# Altium project ultrazed_base.PrjPcb (part 2 of 2)

## Sheet Switches_Leds.SchDoc
size A3; SheetNumber: 9; SheetTotal: 13
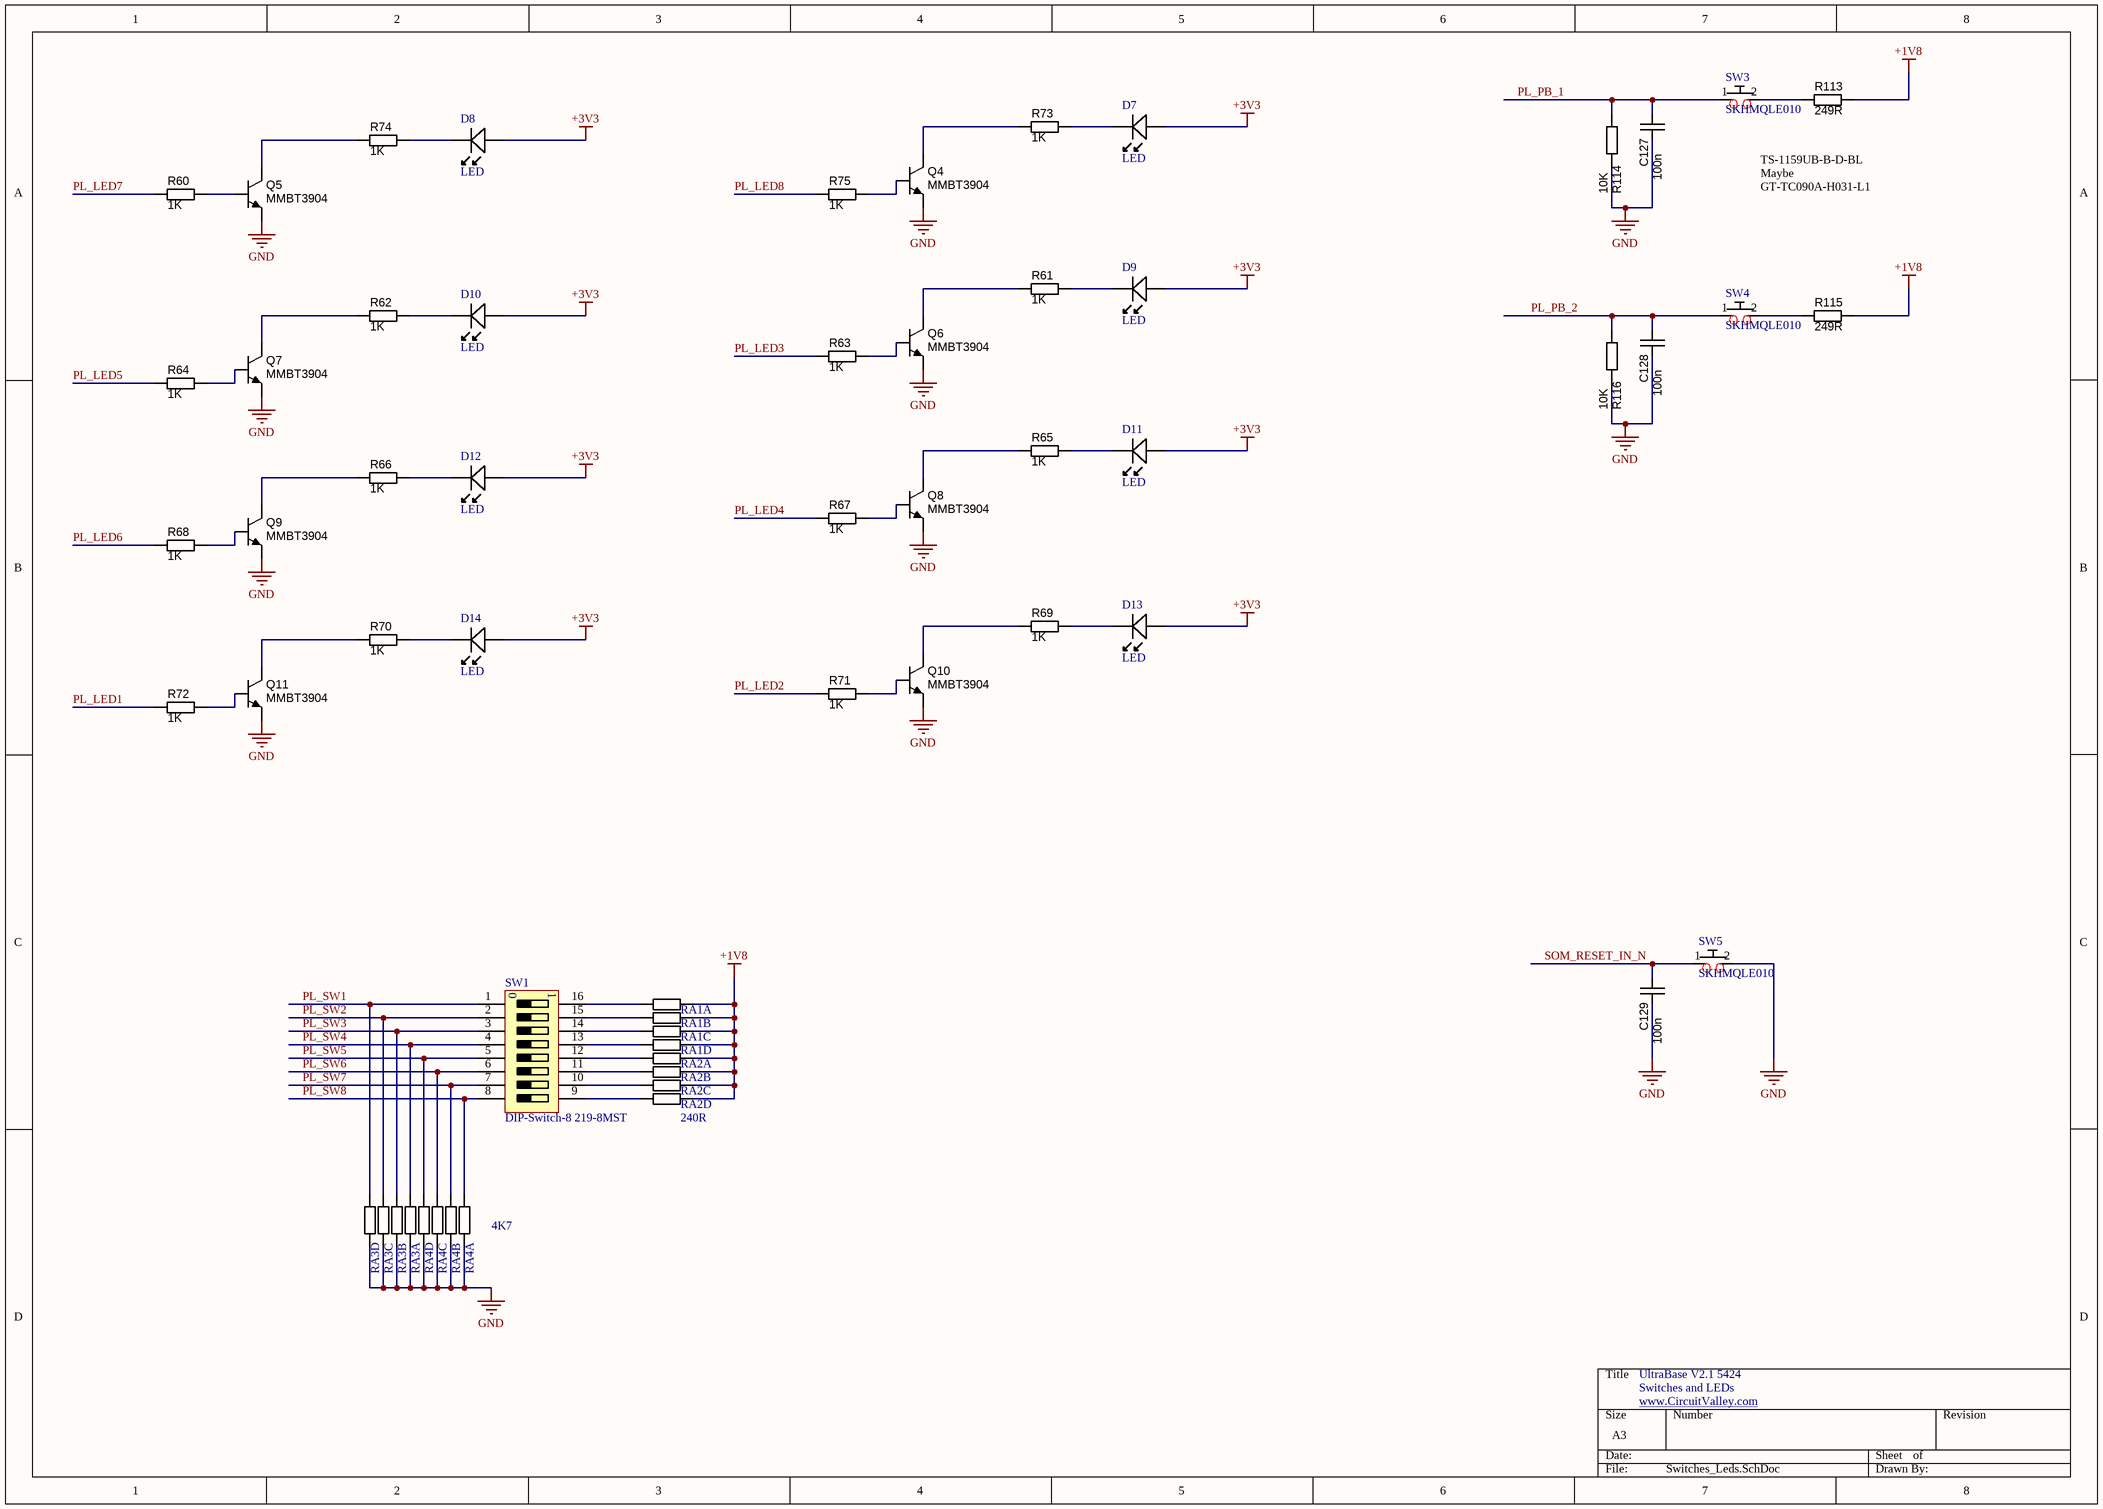
[diagram p8: Switches_Leds.SchDoc]

### Parts
C127  100n  [CAPC1608N]
C128  100n  [CAPC1608N]
C129  100n  [CAPC1608N]
D7  LED  [1206_LED]
D8  LED  [1206_LED]
D9  LED  [1206_LED]
D10  LED  [1206_LED]
D11  LED  [1206_LED]
D12  LED  [1206_LED]
D13  LED  [1206_LED]
D14  LED  [1206_LED]
Q4  Manufacturer Part Number 1: MMBT3904  [SOT23-3]  (hidden comment: NPN_MMBT3904)
Q5  Manufacturer Part Number 1: MMBT3904  [SOT23-3]  (hidden comment: NPN_MMBT3904)
Q6  Manufacturer Part Number 1: MMBT3904  [SOT23-3]  (hidden comment: NPN_MMBT3904)
Q7  Manufacturer Part Number 1: MMBT3904  [SOT23-3]  (hidden comment: NPN_MMBT3904)
Q8  Manufacturer Part Number 1: MMBT3904  [SOT23-3]  (hidden comment: NPN_MMBT3904)
Q9  Manufacturer Part Number 1: MMBT3904  [SOT23-3]  (hidden comment: NPN_MMBT3904)
Q10  Manufacturer Part Number 1: MMBT3904  [SOT23-3]  (hidden comment: NPN_MMBT3904)
Q11  Manufacturer Part Number 1: MMBT3904  [SOT23-3]  (hidden comment: NPN_MMBT3904)
R60  value 1K  [RESC1608N]  (hidden comment: RES_NL_0603)
R61  value 1K  [RESC1608N]  (hidden comment: RES_NL_0603)
R62  value 1K  [RESC1608N]  (hidden comment: RES_NL_0603)
R63  value 1K  [RESC1608N]  (hidden comment: RES_NL_0603)
R64  value 1K  [RESC1608N]  (hidden comment: RES_NL_0603)
R65  value 1K  [RESC1608N]  (hidden comment: RES_NL_0603)
R66  value 1K  [RESC1608N]  (hidden comment: RES_NL_0603)
R67  value 1K  [RESC1608N]  (hidden comment: RES_NL_0603)
R68  value 1K  [RESC1608N]  (hidden comment: RES_NL_0603)
R69  value 1K  [RESC1608N]  (hidden comment: RES_NL_0603)
R70  value 1K  [RESC1608N]  (hidden comment: RES_NL_0603)
R71  value 1K  [RESC1608N]  (hidden comment: RES_NL_0603)
R72  value 1K  [RESC1608N]  (hidden comment: RES_NL_0603)
R73  value 1K  [RESC1608N]  (hidden comment: RES_NL_0603)
R74  value 1K  [RESC1608N]  (hidden comment: RES_NL_0603)
R75  value 1K  [RESC1608N]  (hidden comment: RES_NL_0603)
R113  value 249R  [RESC1608N]  (hidden comment: RES_NL_0603)
R114  value 10K  [RESC1608N]  (hidden comment: RES_NL_0603)
R115  value 249R  [RESC1608N]  (hidden comment: RES_NL_0603)
R116  value 10K  [RESC1608N]  (hidden comment: RES_NL_0603)
RA1  Thick Film  [YC164]  (value not drawn)  (parts A,B,C,D of 4)
RA2  Thick Film  [YC164]  (value not drawn)  (parts A,B,C,D of 4)
RA3  Thick Film  [YC164]  (value not drawn)  (parts A,B,C,D of 4)
RA4  Thick Film  [YC164]  (value not drawn)  (parts A,B,C,D of 4)
SW1  DIP-Switch-8 219-8MST  [219-8MST]
SW3  SKHMQLE010  [SKHMQLE010]
SW4  SKHMQLE010  [SKHMQLE010]
SW5  SKHMQLE010  [SKHMQLE010]

### Nets
+1V8: R113.1 R115.1 RA1.1 RA1.2 RA1.3 RA1.4 RA2.1 RA2.2 RA2.3 RA2.4
+3V3: D7.A D8.A D9.A D10.A D11.A D12.A D13.A D14.A
GND: C127.2 C128.2 C129.2 Q4.2(E) Q5.2(E) Q6.2(E) Q7.2(E) Q8.2(E) Q9.2(E) Q10.2(E) Q11.2(E) R114.1 R116.1 RA3.1 RA3.2 RA3.3 RA3.4 RA4.1 RA4.2 RA4.3 RA4.4 SW5.2(P2)
PL_LED1: R72.1
PL_LED2: R71.1
PL_LED3: R63.1
PL_LED4: R67.1
PL_LED5: R64.1
PL_LED6: R68.1
PL_LED7: R60.1
PL_LED8: R75.1
PL_PB_1: C127.1 R114.2 SW3.1(P1)
PL_PB_2: C128.1 R116.2 SW4.1(P1)
PL_SW1: RA3.5 SW1.1
PL_SW2: RA3.6 SW1.2
PL_SW3: RA3.7 SW1.3
PL_SW4: RA3.8 SW1.4
PL_SW5: RA4.5 SW1.5
PL_SW6: RA4.6 SW1.6
PL_SW7: RA4.7 SW1.7
PL_SW8: RA4.8 SW1.8
SOM_RESET_IN_N: C129.1 SW5.1(P1)
NetD7_K: D7.K R73.2
NetD8_K: D8.K R74.2
NetD9_K: D9.K R61.2
NetD10_K: D10.K R62.2
NetD11_K: D11.K R65.2
NetD12_K: D12.K R66.2
NetD13_K: D13.K R69.2
NetD14_K: D14.K R70.2
NetQ4_1: Q4.1(B) R75.2
NetQ4_3: Q4.3(C) R73.1
NetQ5_1: Q5.1(B) R60.2
NetQ5_3: Q5.3(C) R74.1
NetQ6_1: Q6.1(B) R63.2
NetQ6_3: Q6.3(C) R61.1
NetQ7_1: Q7.1(B) R64.2
NetQ7_3: Q7.3(C) R62.1
NetQ8_1: Q8.1(B) R67.2
NetQ8_3: Q8.3(C) R65.1
NetQ9_1: Q9.1(B) R68.2
NetQ9_3: Q9.3(C) R66.1
NetQ10_1: Q10.1(B) R71.2
NetQ10_3: Q10.3(C) R69.1
NetQ11_1: Q11.1(B) R72.2
NetQ11_3: Q11.3(C) R70.1
NetR113_2: R113.2 SW3.2(P2)
NetR115_2: R115.2 SW4.2(P2)
NetRA1_5: RA1.5 SW1.13
NetRA1_6: RA1.6 SW1.14
NetRA1_7: RA1.7 SW1.15
NetRA1_8: RA1.8 SW1.16
NetRA2_5: RA2.5 SW1.9
NetRA2_6: RA2.6 SW1.10
NetRA2_7: RA2.7 SW1.11
NetRA2_8: RA2.8 SW1.12

### Notes on the sheet
- TS-1159UB-B-D-BL
  Maybe GT-TC090A-H031-L1 as SKHMQLE010 Replament .
- (near RA2) 240R
- (near RA4) 4K7
- UltraBase V2.1 5424
- Switches and LEDs
- www.CircuitValley.com <http://www.CircuitValley.com>
- (in symbol DIP-Switch-8) 0

### Library data of the parts
C127-C129 = CAPC_120p_0603_C0G_50V: Capacitor SMD Cer 120pF 10% 50V C0G 0603; Manufacturer 1: Kemet; Manufacturer Part Number 1: C0603C121K5GACTU; Ratings: 50V; C0G; Tolerance: ±10%; Operating Temperature: -55°C ~ 125°C; Package / Case: 0603 (1608 Metric); Supplier 1: Mouser; Supplier Part Number 1: 80-C0603C121K5G; Value: 100n
Q4-Q11 = NPN_MMBT3904: Transistor SMD NPN 40V 0.2A 350mW SOT-23; Manufacturer 1: Fairchild Semiconductor; Ratings: 40V; 200mA; 350mW; Material: Si; Package / Case: SOT-23; Supplier 1: Digi-Key; Supplier Part Number 1: MMBT3904FSCT-ND; Transistor Type: NPN; Mounting Type: Surface Mount
R60-R75 R113-R116 = RES_NL_0603: as R17 on sheet PCIe; Package / Case: 0603 (1608 metric)
RA1 = RES_ARRAY_0402_5%: Resistor array 4-pack 5% 0402 SMD; Value: 240R
RA2 RA3 = RES_ARRAY_0402_5%: Resistor array 4-pack 5% 0402 SMD
RA4 = RES_ARRAY_0402_5%: Resistor array 4-pack 5% 0402 SMD; Value: 4.7K
SW1 = DIP-Switch-8: DIP Switch 8 Position
SW3-SW5 = PushButton

## Sheet PWR_INP.SchDoc
size A3; SheetNumber: 10; SheetTotal: 13
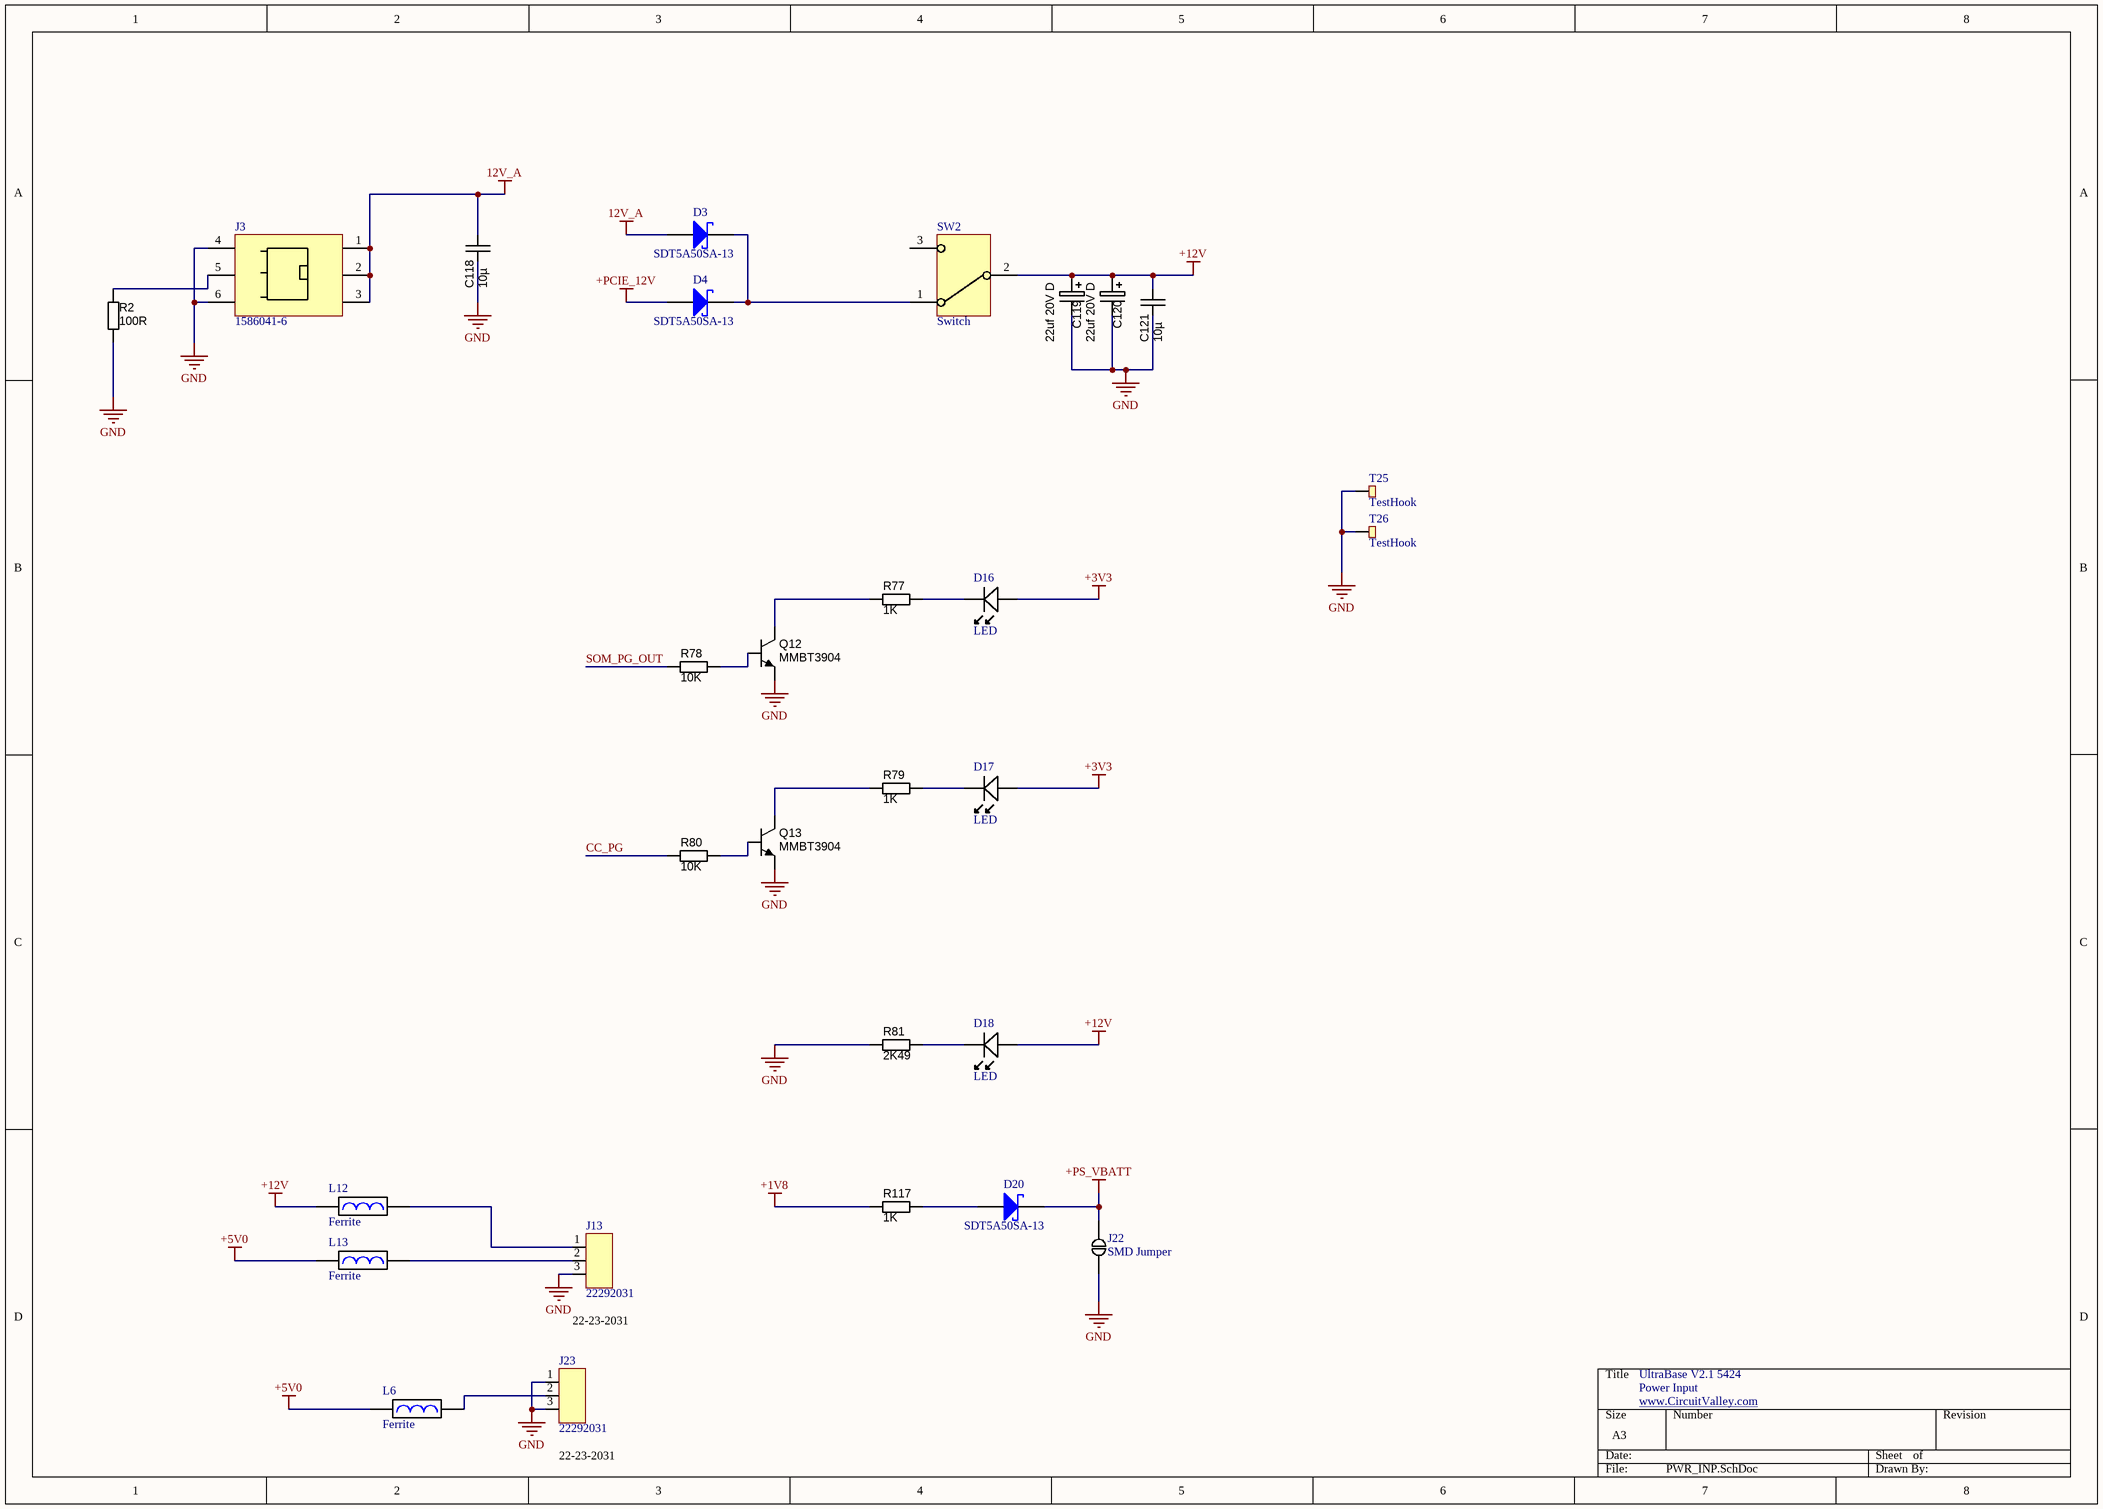
[diagram p9: PWR_INP.SchDoc]

### Parts
C118  10µ  [CAPC3225N]
C119  value 22uf 20V D  [CAPMP7343X310N]  (hidden comment: 47uf 20V D)
C120  value 22uf 20V D  [CAPMP7343X310N]  (hidden comment: 47uf 20V D)
C121  10µ  [CAPC3225N]
D3  SDT5A50SA-13  [DO-214AC]
D4  SDT5A50SA-13  [DO-214AC]
D16  LED  [1206_LED]
D17  LED  [1206_LED]
D18  LED  [1206_LED]
D20  SDT5A50SA-13  [DO-214AC]
J3  1586041-6  [1586043-6]
J13  22292031  [22-23-2031]
J22  SMD Jumper  [SMD_Jumper]  (net tie, no BOM)
J23  22292031  [22-23-2031]
L6  Ferrite  [FBC2012N]
L12  Ferrite  [FBC2012N]
L13  Ferrite  [FBC2012N]
Q12  Manufacturer Part Number 1: MMBT3904  [SOT23-3]  (hidden comment: NPN_MMBT3904)
Q13  Manufacturer Part Number 1: MMBT3904  [SOT23-3]  (hidden comment: NPN_MMBT3904)
R2  value 100R  [RESC1608N]  (hidden comment: RES_NL_0603)
R77  value 1K  [RESC1608N]  (hidden comment: RES_NL_0603)
R78  value 10K  [RESC1608N]  (hidden comment: RES_NL_0603)
R79  value 1K  [RESC1608N]  (hidden comment: RES_NL_0603)
R80  value 10K  [RESC1608N]  (hidden comment: RES_NL_0603)
R81  value 2K49  [RESC1608N]  (hidden comment: RES_NL_0603)
R117  value 1K  [RESC1608N]  (hidden comment: RES_NL_0603)
SW2  Switch  [1MS1T1B4M7QES]
T25  TestHook  [1502-x]
T26  TestHook  [1502-x]

### Nets
12V_A: C118.1 D3.1(A) J3.1(IN) J3.2(IN) J3.3(IN)
+1V8: R117.1
+3V3: D16.A D17.A
+5V0: L6.1 L13.1
+12V: C119.1 C120.1 C121.1 D18.A L12.1 SW2.2
+PCIE_12V: D4.1(A)
+PS_VBATT: D20.2(K) J22.2
GND: C118.2 C119.2 C120.2 C121.2 J3.4(IN) J3.6 J13.3 J22.1 J23.1 J23.3 Q12.2(E) Q13.2(E) R2.2 R81.1 T25.1(TP) T26.1(TP)
CC_PG: R80.1
SOM_PG_OUT: R78.1
NetD3_2: D3.2(K) D4.2(K) SW2.1
NetD16_K: D16.K R77.2
NetD17_K: D17.K R79.2
NetD18_K: D18.K R81.2
NetD20_1: D20.1(A) R117.2
NetJ3_5: J3.5 R2.1
NetJ13_1: J13.1 L12.2
NetJ13_2: J13.2 L13.2
NetJ23_2: J23.2 L6.2
NetQ12_1: Q12.1(B) R78.2
NetQ12_3: Q12.3(C) R77.1
NetQ13_1: Q13.1(B) R80.2
NetQ13_3: Q13.3(C) R79.1

Not connected (* = marked no-connect by the designer): SW2 3

### Notes on the sheet
- 22-23-2031
- UltraBase V2.1 5424
- Power Input
- (near J23) 22-23-2031
- www.CircuitValley.com <http://www.CircuitValley.com>

### Library data of the parts
C118 C121 = CAPC_10u_1210_50V: Capacitor SMD Cer 10uF 20% 16V X5R 1210; Manufacturer 1: Taiyo Yuden; Manufacturer Part Number 1: UMK325BJ106MM-T; Ratings: 50V; X5R; Material: ceramic; Package / Case: 1210 (3225 Metric); Tolerance: ±20%; Size / Dimension: 0.126" L x 0.098" W (3.20mm x 2.50mm); Supplier 1: Digi-Key; Supplier Part Number 1: 587-2225-1-ND; Value: 10µ
C119 C120 = CAPT_330u_2917_6V3: Capacitor SMD Tant 330uF 20% 6V3 2917; Manufacturer Part Number: T520D337M006ATE015; Part: TCJY226M025R0070; Ratings: 6.3V; Material: Solid Tantalum; ESR (Equivalent Series Resistance): 15 mOhm; Package / Case: 2917 (7343 Metric); Tolerance: ±20%; Operating Temperature: -55°C ~ 125°C; Size / Dimension: 0.287" L x 0.169" W (7.30mm x 4.30mm); Height - Seated (Max): 0.122" (3.10mm); Manufacturer Size Code: D; Supplier 1: Digi-Key; Supplier Part Number 1: 399-4052-1-ND; ComponentLink1URL: http://www.kemet.com/datasheets&T520D337M006ATE015; ComponentLink1Description: T520D Datasheet
D3 D4 D20 = Diode
J3 = 1586041-6: PCIE Molex Power
J22 = SMD_Jumper
L6 L12 L13 = Ferrite Bead
Q12 Q13 = NPN_MMBT3904: as Q4 on sheet Switches_Leds; Package / Case: SOT-23; Supplier 1: Digi-Key; Supplier Part Number 1: MMBT3904FSCT-ND; Transistor Type: NPN; Mounting Type: Surface Mount
R2 R77-R81 R117 = RES_NL_0603: as R17 on sheet PCIe; Package / Case: 0603 (1608 metric)
SW2 = Switch_SPDT: Switch SPDT

## Sheet IO.SchDoc
size A3; SheetNumber: 11; SheetTotal: 13
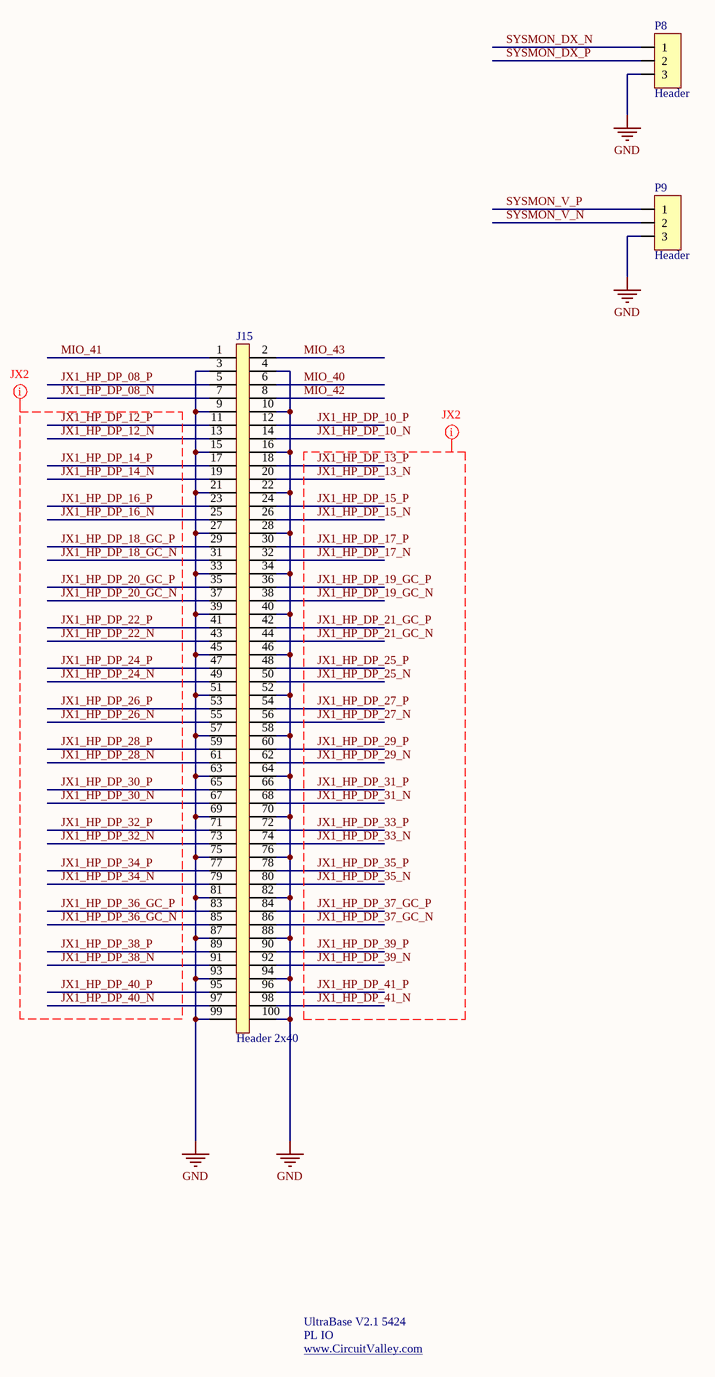
[diagram p10: IO.SchDoc]

### Parts
J15  Header 2x40  [Header_2x50]
P8  Header  [Header3x]
P9  Header  [Header3x]

### Nets
GND: J15.3 J15.4 J15.9 J15.10 J15.15 J15.16 J15.21 J15.22 J15.27 J15.28 J15.33 J15.34 J15.39 J15.40 J15.45 J15.46 J15.51 J15.52 J15.57 J15.58 J15.63 J15.64 J15.69 J15.70 J15.75 J15.76 J15.81 J15.82 J15.87 J15.88 J15.93 J15.94 J15.99 J15.100 P8.3 P9.3
JX1_HP_DP_08_N: J15.7
JX1_HP_DP_08_P: J15.5
JX1_HP_DP_10_N: J15.14
JX1_HP_DP_10_P: J15.12
JX1_HP_DP_12_N: J15.13
JX1_HP_DP_12_P: J15.11
JX1_HP_DP_13_N: J15.20
JX1_HP_DP_13_P: J15.18
JX1_HP_DP_14_N: J15.19
JX1_HP_DP_14_P: J15.17
JX1_HP_DP_15_N: J15.26
JX1_HP_DP_15_P: J15.24
JX1_HP_DP_16_N: J15.25
JX1_HP_DP_16_P: J15.23
JX1_HP_DP_17_N: J15.32
JX1_HP_DP_17_P: J15.30
JX1_HP_DP_18_GC_N: J15.31
JX1_HP_DP_18_GC_P: J15.29
JX1_HP_DP_19_GC_N: J15.38
JX1_HP_DP_19_GC_P: J15.36
JX1_HP_DP_20_GC_N: J15.37
JX1_HP_DP_20_GC_P: J15.35
JX1_HP_DP_21_GC_N: J15.44
JX1_HP_DP_21_GC_P: J15.42
JX1_HP_DP_22_N: J15.43
JX1_HP_DP_22_P: J15.41
JX1_HP_DP_24_N: J15.49
JX1_HP_DP_24_P: J15.47
JX1_HP_DP_25_N: J15.50
JX1_HP_DP_25_P: J15.48
JX1_HP_DP_26_N: J15.55
JX1_HP_DP_26_P: J15.53
JX1_HP_DP_27_N: J15.56
JX1_HP_DP_27_P: J15.54
JX1_HP_DP_28_N: J15.61
JX1_HP_DP_28_P: J15.59
JX1_HP_DP_29_N: J15.62
JX1_HP_DP_29_P: J15.60
JX1_HP_DP_30_N: J15.67
JX1_HP_DP_30_P: J15.65
JX1_HP_DP_31_N: J15.68
JX1_HP_DP_31_P: J15.66
JX1_HP_DP_32_N: J15.73
JX1_HP_DP_32_P: J15.71
JX1_HP_DP_33_N: J15.74
JX1_HP_DP_33_P: J15.72
JX1_HP_DP_34_N: J15.79
JX1_HP_DP_34_P: J15.77
JX1_HP_DP_35_N: J15.80
JX1_HP_DP_35_P: J15.78
JX1_HP_DP_36_GC_N: J15.85
JX1_HP_DP_36_GC_P: J15.83
JX1_HP_DP_37_GC_N: J15.86
JX1_HP_DP_37_GC_P: J15.84
JX1_HP_DP_38_N: J15.91
JX1_HP_DP_38_P: J15.89
JX1_HP_DP_39_N: J15.92
JX1_HP_DP_39_P: J15.90
JX1_HP_DP_40_N: J15.97
JX1_HP_DP_40_P: J15.95
JX1_HP_DP_41_N: J15.98
JX1_HP_DP_41_P: J15.96
MIO_40: J15.6
MIO_41: J15.1
MIO_42: J15.8
MIO_43: J15.2
SYSMON_DX_N: P8.1
SYSMON_DX_P: P8.2
SYSMON_V_N: P9.2
SYSMON_V_P: P9.1

### Layout directives
net class JX2: JX1_HP_DP_12_N, JX1_HP_DP_12_P, JX1_HP_DP_13_N, JX1_HP_DP_13_P, JX1_HP_DP_14_N, JX1_HP_DP_14_P, JX1_HP_DP_15_N, JX1_HP_DP_15_P, JX1_HP_DP_16_N, JX1_HP_DP_16_P, JX1_HP_DP_17_N, JX1_HP_DP_17_P, JX1_HP_DP_18_GC_N, JX1_HP_DP_18_GC_P, JX1_HP_DP_19_GC_N, JX1_HP_DP_19_GC_P, JX1_HP_DP_20_GC_N, JX1_HP_DP_20_GC_P, JX1_HP_DP_21_GC_N, JX1_HP_DP_21_GC_P, JX1_HP_DP_22_N, JX1_HP_DP_22_P, JX1_HP_DP_24_N, JX1_HP_DP_24_P, JX1_HP_DP_25_N, JX1_HP_DP_25_P, JX1_HP_DP_26_N, JX1_HP_DP_26_P, JX1_HP_DP_27_N, JX1_HP_DP_27_P, JX1_HP_DP_28_N, JX1_HP_DP_28_P, JX1_HP_DP_29_N, JX1_HP_DP_29_P, JX1_HP_DP_30_N, JX1_HP_DP_30_P, JX1_HP_DP_31_N, JX1_HP_DP_31_P, JX1_HP_DP_32_N, JX1_HP_DP_32_P, JX1_HP_DP_33_N, JX1_HP_DP_33_P, JX1_HP_DP_34_N, JX1_HP_DP_34_P, JX1_HP_DP_35_N, JX1_HP_DP_35_P, JX1_HP_DP_36_GC_N, JX1_HP_DP_36_GC_P, JX1_HP_DP_37_GC_N, JX1_HP_DP_37_GC_P, JX1_HP_DP_38_N, JX1_HP_DP_38_P, JX1_HP_DP_39_N, JX1_HP_DP_39_P, JX1_HP_DP_40_N, JX1_HP_DP_40_P, JX1_HP_DP_41_N, JX1_HP_DP_41_P

### Notes on the sheet
- UltraBase V2.1 5424
- PL IO
- www.CircuitValley.com <http://www.CircuitValley.com>

### Library data of the parts
J15 = Header_2x50
P8 P9 = Header_3Pin: 3 Pin Header; Value: NC

## Sheet JTAG.SchDoc
size A3; SheetNumber: 12; SheetTotal: 13
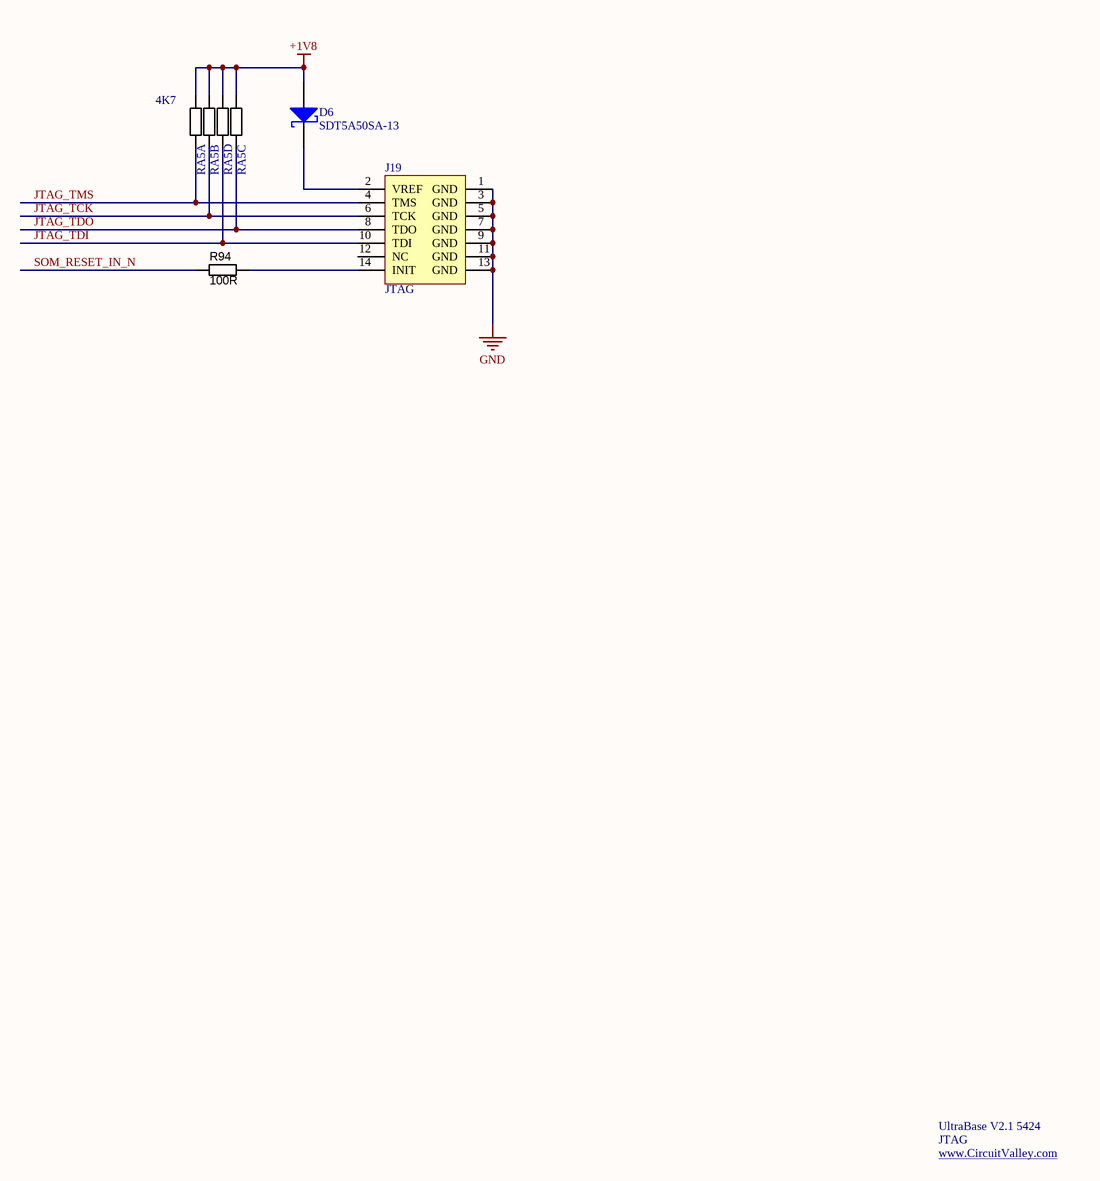
[diagram p11: JTAG.SchDoc]

### Parts
D6  SDT5A50SA-13  [DO-214AC]
J19  JTAG  [878321420]
R94  value 100R  [RESC1608N]  (hidden comment: RES_NL_0603)
RA5  Thick Film  [YC164]  (value not drawn)  (parts A,B,C,D of 4)

### Nets
+1V8: D6.1(A) RA5.5 RA5.6 RA5.7 RA5.8
GND: J19.1(GND) J19.3(GND) J19.5(GND) J19.7(GND) J19.9(GND) J19.11(GND) J19.13(GND)
JTAG_TCK: J19.6(TCK) RA5.2
JTAG_TDI: J19.10(TDI) RA5.4
JTAG_TDO: J19.8(TDO) RA5.3
JTAG_TMS: J19.4(TMS) RA5.1
SOM_RESET_IN_N: R94.2
NetD6_2: D6.2(K) J19.2(VREF)
NetJ19_14: J19.14(INIT) R94.1

Not connected (* = marked no-connect by the designer): J19 12(NC)

### Notes on the sheet
- (near RA5) 4K7
- UltraBase V2.1 5424
- JTAG
- www.CircuitValley.com <http://www.CircuitValley.com>

### Library data of the parts
D6 = Diode
J19 = Xilinx_JTAG
R94 = RES_NL_0603: as R17 on sheet PCIe; Package / Case: 0603 (1608 metric)
RA5 = RES_ARRAY_0402_5%: Resistor array 4-pack 5% 0402 SMD

## Sheet MIPI.SchDoc
size A3; SheetNumber: 13; SheetTotal: 13
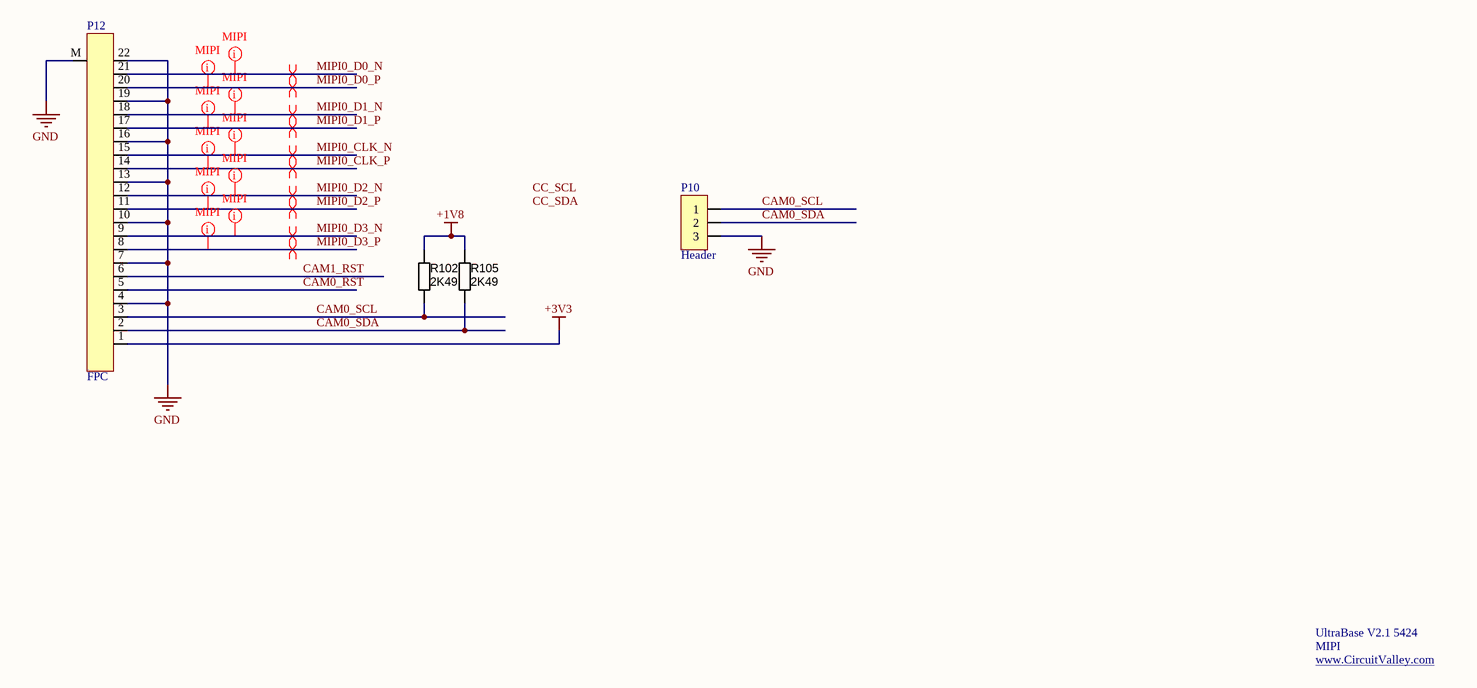
[diagram p12: MIPI.SchDoc]

### Parts
P10  Header  [Header3x]
P12  FPC  [AFC11-S22ICA-00]
R102  value 2K49  [RESC1608N]  (hidden comment: RES_NL_0603)
R105  value 2K49  [RESC1608N]  (hidden comment: RES_NL_0603)

### Nets
+1V8: R102.2 R105.2
+3V3: P12.1
GND: P10.3 P12.4 P12.7 P12.10 P12.13 P12.16 P12.19 P12.22 P12.M
CAM0_RST: P12.5
CAM0_SCL: P10.1 P12.3 R102.1
CAM0_SDA: P10.2 P12.2 R105.1
CAM1_RST: P12.6
MIPI0_CLK_N: P12.15
MIPI0_CLK_P: P12.14
MIPI0_D0_N: P12.21
MIPI0_D0_P: P12.20
MIPI0_D1_N: P12.18
MIPI0_D1_P: P12.17
MIPI0_D2_N: P12.12
MIPI0_D2_P: P12.11
MIPI0_D3_N: P12.9
MIPI0_D3_P: P12.8

### Layout directives
differential pair: MIPI0_CLK_N, MIPI0_CLK_P, MIPI0_D0_N, MIPI0_D0_P, MIPI0_D1_N, MIPI0_D1_P, MIPI0_D2_N, MIPI0_D2_P, MIPI0_D3_N, MIPI0_D3_P
net class MIPI: MIPI0_CLK_N, MIPI0_CLK_P, MIPI0_D0_N, MIPI0_D0_P, MIPI0_D1_N, MIPI0_D1_P, MIPI0_D2_N, MIPI0_D2_P, MIPI0_D3_N, MIPI0_D3_P

### Notes on the sheet
- UltraBase V2.1 5424
- MIPI
- www.CircuitValley.com <http://www.CircuitValley.com>
- Labels drawn without touching a wire or pin: CC_SCL, CC_SDA

### Library data of the parts
P10 = Header_3Pin: 3 Pin Header; Value: NC
P12 = FPC22_PIN: FPC 22 Pin
R102 R105 = RES_NL_0603: Resistor, SMD chip; Manufacturer 1: Royal Ohm; Ratings: 1/10 W; Tolerance: ±5%; Package / Case: 0603 (1608 metric)

## Nets that join several sheets
+0V85: SOM_JX_MIO (C1.1 C2.1 C62.1), POWER (10 pins)
+1V8: PL_Conenctor (9 pins), POWER (16 pins), Ethernet (7 pins), Clock (6 pins), Switches_Leds (10 pins), PWR_INP (R117.1), JTAG (5 pins), MIPI (R102.2 R105.2)
+1V8_LDO: SOM_JX_MIO (C3.1 C4.1), POWER (6 pins)
+3V3: PL_Conenctor (C8.1 C9.1 C10.1), PCIe (D19.A P3.1 R17.1 R40.2), SOM_JX_MIO (C60.1), MIO_SD (7 pins), POWER (11 pins), Ethernet (J6.14 J6.16), DisplayPort (11 pins), Switches_Leds (8 pins), PWR_INP (D16.A D17.A), MIPI (P12.1)
+5V0: PCIe (C48.1 U3.7), POWER (7 pins), DisplayPort (C63.1 U8.1 U8.3), PWR_INP (L6.1 L13.1)
+12V: PL_Conenctor (C11.1 C12.1 C13.1 C14.1), POWER (27 pins), PWR_INP (6 pins)
+MGTRAVCC: SOM_JX_MIO (JX3.31 JX3.37 JX3.39), POWER (T8.2 T9.2 T10.2)
+MGTRAVTT: SOM_JX_MIO (JX3.36 JX3.42), POWER (T14.2 T16.2)
+PCIE_12V: PCIe (8 pins), PWR_INP (D4.1)
+PS_VBATT: SOM_JX_MIO (JX3.46), PWR_INP (D20.2 J22.2)
+VCCO_HD_26: PL_Conenctor (JX2.18 JX2.24 JX2.30), POWER (T2.2 T4.2 T6.2)
+VCCO_HP_64: PL_Conenctor (JX1.6 JX1.12 JX1.18), POWER (T12.2 T13.2 T15.2)
+VCCO_HP_65: PL_Conenctor (JX1.5 JX1.7 JX1.13), POWER (T3.2 T5.2 T7.2)
+VCCO_HP_66: PL_Conenctor (JX2.17 JX2.23 JX2.29), POWER (T17.2 T18.2 T19.2)
+VCCO_PSIO_501: SOM_JX_MIO (JX3.67), POWER (T11.2)
+VIN: PL_Conenctor (6 pins), POWER (6 pins)
GND: PL_Conenctor (84 pins), PCIe (32 pins), SOM_JX_MIO (29 pins), MIO_SD (8 pins), POWER (55 pins), Ethernet (11 pins), DisplayPort (27 pins), Clock (14 pins), Switches_Leds (22 pins), PWR_INP (16 pins), IO (36 pins), JTAG (7 pins), MIPI (9 pins)
CAM0_RST: PL_Conenctor (JX1.137), MIPI (P12.5)
CAM0_SCL: SOM_JX_MIO (JX3.81), MIPI (P10.1 P12.3 R102.1)
CAM0_SDA: SOM_JX_MIO (JX3.82), MIPI (P10.2 P12.2 R105.1)
CAM1_RST: PL_Conenctor (JX1.139), MIPI (P12.6)
CC_INT#: SOM_JX_MIO (JX3.68), Ethernet (R89.1)
CC_PG: POWER (6 pins), PWR_INP (R80.1)
CC_SCL: SOM_JX_MIO (JX3.44), Ethernet (R88.1 U9.1), Clock (P5.3)
CC_SDA: SOM_JX_MIO (JX3.41), Ethernet (R87.1 U9.3), Clock (P6.3)
DP_AUX_IN: SOM_JX_MIO (JX3.73), DisplayPort (R38.1)
DP_AUX_OE: SOM_JX_MIO (JX3.72), DisplayPort (R33.1)
DP_AUX_OUT: SOM_JX_MIO (JX3.70), DisplayPort (R34.1)
DP_HPD: SOM_JX_MIO (JX3.71), DisplayPort (R12.2)
DP_REFCLK_N: SOM_JX_MIO (JX3.29), Clock (U7.13)
DP_REFCLK_P: SOM_JX_MIO (JX3.27), Clock (U7.14)
DP_TX0_N: SOM_JX_MIO (JX3.3), DisplayPort (C47.1)
DP_TX0_P: SOM_JX_MIO (JX3.1), DisplayPort (C46.1)
ETH_MD1_N: SOM_JX_MIO (JX3.59), Ethernet (J6.10)
ETH_MD1_P: SOM_JX_MIO (JX3.57), Ethernet (J6.11)
ETH_MD2_N: SOM_JX_MIO (JX3.58), Ethernet (J6.5)
ETH_MD2_P: SOM_JX_MIO (JX3.56), Ethernet (J6.4)
ETH_MD3_N: SOM_JX_MIO (JX3.65), Ethernet (J6.2)
ETH_MD3_P: SOM_JX_MIO (JX3.63), Ethernet (J6.3)
ETH_MD4_N: SOM_JX_MIO (JX3.64), Ethernet (J6.9)
ETH_MD4_P: SOM_JX_MIO (JX3.62), Ethernet (J6.8)
GBE_ACT: SOM_JX_MIO (JX3.52), Ethernet (R10.1)
GBE_SPEED: SOM_JX_MIO (JX3.53), Ethernet (R11.1)
JTAG_TCK: PL_Conenctor (JX1.1), JTAG (J19.6 RA5.2)
JTAG_TDI: PL_Conenctor (JX1.4), JTAG (J19.10 RA5.4)
JTAG_TDO: PL_Conenctor (JX1.3), JTAG (J19.8 RA5.3)
JTAG_TMS: PL_Conenctor (JX1.2), JTAG (J19.4 RA5.1)
JX1_HP_DP_08_N: PL_Conenctor (JX1.35), IO (J15.7)
JX1_HP_DP_08_P: PL_Conenctor (JX1.33), IO (J15.5)
JX1_HP_DP_10_N: PL_Conenctor (JX1.41), IO (J15.14)
JX1_HP_DP_10_P: PL_Conenctor (JX1.39), IO (J15.12)
JX1_HP_DP_12_N: PL_Conenctor (JX1.47), IO (J15.13)
JX1_HP_DP_12_P: PL_Conenctor (JX1.45), IO (J15.11)
JX1_HP_DP_13_N: PL_Conenctor (JX1.46), IO (J15.20)
JX1_HP_DP_13_P: PL_Conenctor (JX1.44), IO (J15.18)
JX1_HP_DP_14_N: PL_Conenctor (JX1.53), IO (J15.19)
JX1_HP_DP_14_P: PL_Conenctor (JX1.51), IO (J15.17)
JX1_HP_DP_15_N: PL_Conenctor (JX1.52), IO (J15.26)
JX1_HP_DP_15_P: PL_Conenctor (JX1.50), IO (J15.24)
JX1_HP_DP_16_N: PL_Conenctor (JX1.59), IO (J15.25)
JX1_HP_DP_16_P: PL_Conenctor (JX1.57), IO (J15.23)
JX1_HP_DP_17_N: PL_Conenctor (JX1.58), IO (J15.32)
JX1_HP_DP_17_P: PL_Conenctor (JX1.56), IO (J15.30)
JX1_HP_DP_18_GC_N: PL_Conenctor (JX1.65), IO (J15.31)
JX1_HP_DP_18_GC_P: PL_Conenctor (JX1.63), IO (J15.29)
JX1_HP_DP_19_GC_N: PL_Conenctor (JX1.64), IO (J15.38)
JX1_HP_DP_19_GC_P: PL_Conenctor (JX1.62), IO (J15.36)
JX1_HP_DP_20_GC_N: PL_Conenctor (JX1.71), IO (J15.37)
JX1_HP_DP_20_GC_P: PL_Conenctor (JX1.69), IO (J15.35)
JX1_HP_DP_21_GC_N: PL_Conenctor (JX1.70), IO (J15.44)
JX1_HP_DP_21_GC_P: PL_Conenctor (JX1.68), IO (J15.42)
JX1_HP_DP_22_N: PL_Conenctor (JX1.77), IO (J15.43)
JX1_HP_DP_22_P: PL_Conenctor (JX1.75), IO (J15.41)
JX1_HP_DP_24_N: PL_Conenctor (JX1.83), IO (J15.49)
JX1_HP_DP_24_P: PL_Conenctor (JX1.81), IO (J15.47)
JX1_HP_DP_25_N: PL_Conenctor (JX1.82), IO (J15.50)
JX1_HP_DP_25_P: PL_Conenctor (JX1.80), IO (J15.48)
JX1_HP_DP_26_N: PL_Conenctor (JX1.89), IO (J15.55)
JX1_HP_DP_26_P: PL_Conenctor (JX1.87), IO (J15.53)
JX1_HP_DP_27_N: PL_Conenctor (JX1.88), IO (J15.56)
JX1_HP_DP_27_P: PL_Conenctor (JX1.86), IO (J15.54)
JX1_HP_DP_28_N: PL_Conenctor (JX1.95), IO (J15.61)
JX1_HP_DP_28_P: PL_Conenctor (JX1.93), IO (J15.59)
JX1_HP_DP_29_N: PL_Conenctor (JX1.94), IO (J15.62)
JX1_HP_DP_29_P: PL_Conenctor (JX1.92), IO (J15.60)
JX1_HP_DP_30_N: PL_Conenctor (JX1.101), IO (J15.67)
JX1_HP_DP_30_P: PL_Conenctor (JX1.99), IO (J15.65)
JX1_HP_DP_31_N: PL_Conenctor (JX1.100), IO (J15.68)
JX1_HP_DP_31_P: PL_Conenctor (JX1.98), IO (J15.66)
JX1_HP_DP_32_N: PL_Conenctor (JX1.107), IO (J15.73)
JX1_HP_DP_32_P: PL_Conenctor (JX1.105), IO (J15.71)
JX1_HP_DP_33_N: PL_Conenctor (JX1.106), IO (J15.74)
JX1_HP_DP_33_P: PL_Conenctor (JX1.104), IO (J15.72)
JX1_HP_DP_34_N: PL_Conenctor (JX1.113), IO (J15.79)
JX1_HP_DP_34_P: PL_Conenctor (JX1.111), IO (J15.77)
JX1_HP_DP_35_N: PL_Conenctor (JX1.112), IO (J15.80)
JX1_HP_DP_35_P: PL_Conenctor (JX1.110), IO (J15.78)
JX1_HP_DP_36_GC_N: PL_Conenctor (JX1.119), IO (J15.85)
JX1_HP_DP_36_GC_P: PL_Conenctor (JX1.117), IO (J15.83)
JX1_HP_DP_37_GC_N: PL_Conenctor (JX1.118), IO (J15.86)
JX1_HP_DP_37_GC_P: PL_Conenctor (JX1.116), IO (J15.84)
JX1_HP_DP_38_N: PL_Conenctor (JX1.125), IO (J15.91)
JX1_HP_DP_38_P: PL_Conenctor (JX1.123), IO (J15.89)
JX1_HP_DP_39_N: PL_Conenctor (JX1.124), IO (J15.92)
JX1_HP_DP_39_P: PL_Conenctor (JX1.122), IO (J15.90)
JX1_HP_DP_40_N: PL_Conenctor (JX1.131), IO (J15.97)
JX1_HP_DP_40_P: PL_Conenctor (JX1.129), IO (J15.95)
JX1_HP_DP_41_N: PL_Conenctor (JX1.130), IO (J15.98)
JX1_HP_DP_41_P: PL_Conenctor (JX1.128), IO (J15.96)
MGTRAVCC_SENSE: SOM_JX_MIO (JX3.75), POWER (L7.1)
MGTRAVTT_SENSE: SOM_JX_MIO (JX3.76), POWER (L10.1)
MIO_40: SOM_JX_MIO (JX3.87), IO (J15.6)
MIO_41: SOM_JX_MIO (JX3.88), IO (J15.1)
MIO_42: SOM_JX_MIO (JX3.89), IO (J15.8)
MIO_43: SOM_JX_MIO (JX3.90), IO (J15.2)
MIPI0_CLK_N: PL_Conenctor (JX2.101), MIPI (P12.15)
MIPI0_CLK_P: PL_Conenctor (JX2.99), MIPI (P12.14)
MIPI0_D0_N: PL_Conenctor (JX2.95), MIPI (P12.21)
MIPI0_D0_P: PL_Conenctor (JX2.93), MIPI (P12.20)
MIPI0_D1_N: PL_Conenctor (JX2.88), MIPI (P12.18)
MIPI0_D1_P: PL_Conenctor (JX2.86), MIPI (P12.17)
MIPI0_D2_N: PL_Conenctor (JX2.89), MIPI (P12.12)
MIPI0_D2_P: PL_Conenctor (JX2.87), MIPI (P12.11)
MIPI0_D3_N: PL_Conenctor (JX2.70), MIPI (P12.9)
MIPI0_D3_P: PL_Conenctor (JX2.68), MIPI (P12.8)
PCIE_REFCLK_N: PCIe (J1.A14), SOM_JX_MIO (JX3.40)
PCIE_REFCLK_P: PCIe (J1.A13), SOM_JX_MIO (JX3.38)
PCIE_RST#: PCIe (R40.1 R41.2), SOM_JX_MIO (JX3.74)
PCIE_RX0_N: PCIe (J1.B15), SOM_JX_MIO (JX3.28)
PCIE_RX0_P: PCIe (J1.B14), SOM_JX_MIO (JX3.26)
PCIE_TX0_N: PCIe (C26.2), SOM_JX_MIO (JX3.23)
PCIE_TX0_P: PCIe (C25.2), SOM_JX_MIO (JX3.21)
PL_LED1: PL_Conenctor (JX1.23), Switches_Leds (R72.1)
PL_LED2: PL_Conenctor (JX1.21), Switches_Leds (R71.1)
PL_LED3: PL_Conenctor (JX1.20), Switches_Leds (R63.1)
PL_LED4: PL_Conenctor (JX1.22), Switches_Leds (R67.1)
PL_LED5: PL_Conenctor (JX1.29), Switches_Leds (R64.1)
PL_LED6: PL_Conenctor (JX1.27), Switches_Leds (R68.1)
PL_LED7: PL_Conenctor (JX1.26), Switches_Leds (R60.1)
PL_LED8: PL_Conenctor (JX1.28), Switches_Leds (R75.1)
PL_PB_1: PL_Conenctor (JX1.138), Switches_Leds (C127.1 R114.2 SW3.1)
PL_PB_2: PL_Conenctor (JX1.136), Switches_Leds (C128.1 R116.2 SW4.1)
PL_SW1: PL_Conenctor (JX1.10), Switches_Leds (RA3.5 SW1.1)
PL_SW2: PL_Conenctor (JX1.8), Switches_Leds (RA3.6 SW1.2)
PL_SW3: PL_Conenctor (JX1.14), Switches_Leds (RA3.7 SW1.3)
PL_SW4: PL_Conenctor (JX1.16), Switches_Leds (RA3.8 SW1.4)
PL_SW5: PL_Conenctor (JX1.9), Switches_Leds (RA4.5 SW1.5)
PL_SW6: PL_Conenctor (JX1.11), Switches_Leds (RA4.6 SW1.6)
PL_SW7: PL_Conenctor (JX1.15), Switches_Leds (RA4.7 SW1.7)
PL_SW8: PL_Conenctor (JX1.17), Switches_Leds (RA4.8 SW1.8)
PL_SYSCLK_N: PL_Conenctor (JX2.76), Clock (R57.2 U7.12)
PL_SYSCLK_P: PL_Conenctor (JX2.74), Clock (R57.1 U7.11)
PMBUS_ALERT#: PL_Conenctor (JX2.35), POWER (U5.17)
PMBUS_SCL: PL_Conenctor (JX2.12), POWER (P11.1 U5.18)
PMBUS_SDA: PL_Conenctor (JX2.11), POWER (P11.2 U5.19)
PS_LED1: SOM_JX_MIO (JX3.69), MIO_SD (R55.1)
SATA_REFCLK_N: SOM_JX_MIO (JX3.35), Clock (U7.16)
SATA_REFCLK_P: SOM_JX_MIO (JX3.33), Clock (U7.17)
SATA_RX_N: PCIe (C38.1), SOM_JX_MIO (JX3.20)
SATA_RX_P: PCIe (C39.1), SOM_JX_MIO (JX3.18)
SATA_TX_N: PCIe (C37.1), SOM_JX_MIO (JX3.15)
SATA_TX_P: PCIe (C36.1), SOM_JX_MIO (JX3.13)
SD_CD#: SOM_JX_MIO (JX3.94), MIO_SD (J2.9 R5.2)
SD_CLK: SOM_JX_MIO (JX3.100), MIO_SD (R7.1)
SD_CMD: SOM_JX_MIO (JX3.99), MIO_SD (J2.3 R6.2)
SD_D0: SOM_JX_MIO (JX3.95), MIO_SD (J2.7)
SD_D1: SOM_JX_MIO (JX3.96), MIO_SD (J2.8)
SD_D2: SOM_JX_MIO (JX3.97), MIO_SD (J2.1)
SD_D3: SOM_JX_MIO (JX3.98), MIO_SD (J2.2)
SD_WP: SOM_JX_MIO (JX3.93), MIO_SD (J4.1 R8.1)
SOM_PG_OUT: PL_Conenctor (JX2.41), POWER (R26.2), PWR_INP (R78.1)
SOM_RESET_IN_N: PL_Conenctor (JX2.42), Switches_Leds (C129.1 SW5.1), JTAG (R94.2)
SYSMON_DX_N: PL_Conenctor (JX2.2), IO (P8.1)
SYSMON_DX_P: PL_Conenctor (JX2.4), IO (P8.2)
SYSMON_V_N: PL_Conenctor (JX2.1), IO (P9.2)
SYSMON_V_P: PL_Conenctor (JX2.3), IO (P9.1)
USB3_REFCLK_N: SOM_JX_MIO (JX3.34), Clock (U7.19)
USB3_REFCLK_P: SOM_JX_MIO (JX3.32), Clock (U7.20)
USB3_RX_N: PCIe (J7.9 U2.4 U2.7), SOM_JX_MIO (JX3.12)
USB3_RX_P: PCIe (J7.10 U2.5 U2.6), SOM_JX_MIO (JX3.10)
USB3_TX_N: PCIe (C44.1), SOM_JX_MIO (JX3.9)
USB3_TX_P: PCIe (C45.1), SOM_JX_MIO (JX3.7)
USB_CPEN: PCIe (R17.2 U3.1), SOM_JX_MIO (JX3.48)
USB_ID: PCIe (P3.2), SOM_JX_MIO (JX3.51)
USB_OTG_N: PCIe (J7.2 U4.1 U4.10), SOM_JX_MIO (JX3.47)
USB_OTG_P: PCIe (J7.3 U4.2 U4.9), SOM_JX_MIO (JX3.45)
VBUS_DETECT: PCIe (R20.1), SOM_JX_MIO (JX3.50)
VCCO_HD_26_SENSE: SOM_JX_MIO (JX3.84), POWER (L9.1)
VCCO_HP_64_SENSE: SOM_JX_MIO (JX3.92), POWER (R46.2)
VCCO_HP_65_SENSE: SOM_JX_MIO (JX3.91), POWER (R48.2)
VCCO_HP_66_SENSE: SOM_JX_MIO (JX3.83), POWER (R51.2)